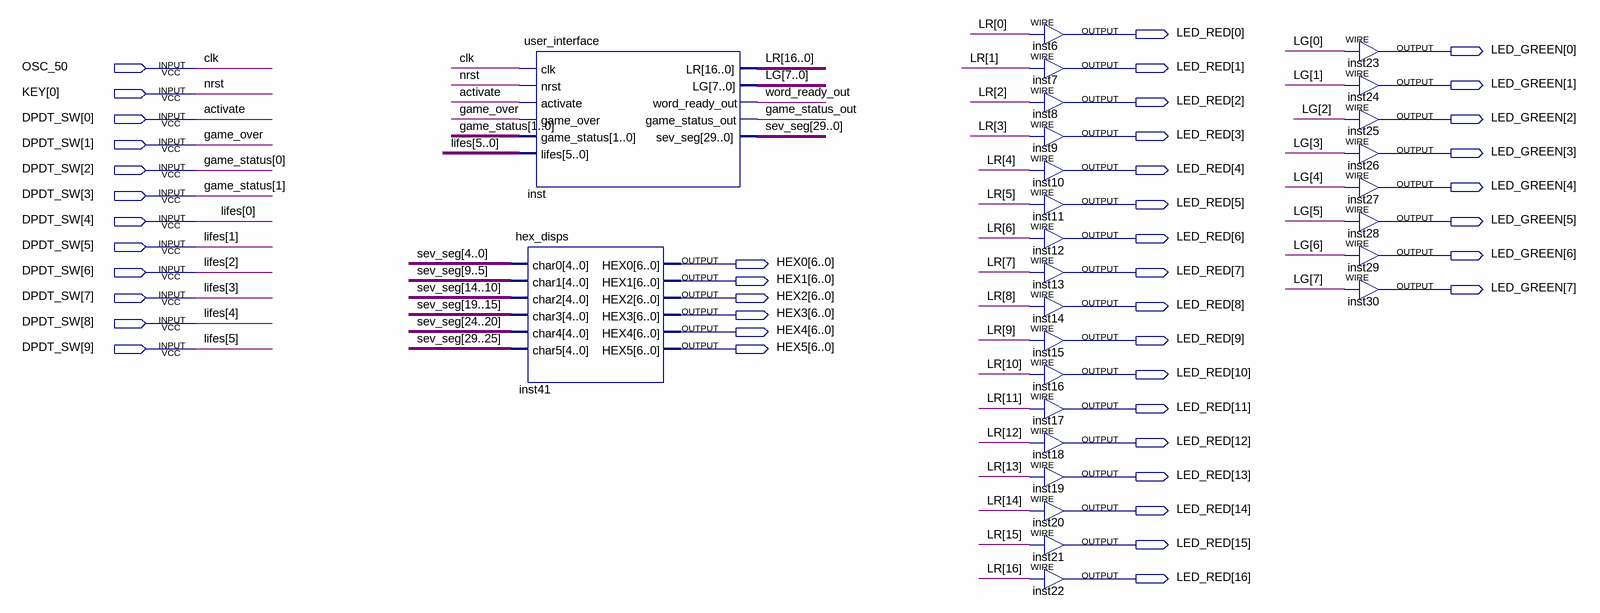
[diagram p0: schematic sheet]
// Quartus schematic user_interface_tes.bdf as structural Verilog: 27 symbols, 43 pins
module user_interface_tes (
  input  OSC_50,
  input  [0:0] KEY,
  input  [9:0] DPDT_SW,
  output [16:0] LED_RED,
  output [7:0] LED_GREEN,
  output [6:0] HEX0,
  output [6:0] HEX1,
  output [6:0] HEX2,
  output [6:0] HEX3,
  output [6:0] HEX4,
  output [6:0] HEX5
);

  wire game_status_out, word_ready_out;
  wire [7:0] LG;
  wire [16:0] LR;
  wire [29:0] sev_seg;

  user_interface inst (
    .clk(OSC_50), .nrst(KEY[0]), .activate(DPDT_SW[0]), .game_over(DPDT_SW[1]), .game_status(DPDT_SW[3:2]),
    .lifes(DPDT_SW[9:4]), .LR(LR), .LG(LG), .word_ready_out(word_ready_out),
    .game_status_out(game_status_out), .sev_seg(sev_seg));
  hex_disps inst41 (
    .char0(sev_seg[4:0]), .char1(sev_seg[9:5]), .char2(sev_seg[14:10]), .char3(sev_seg[19:15]),
    .char4(sev_seg[24:20]), .char5(sev_seg[29:25]), .HEX0(HEX0), .HEX1(HEX1), .HEX2(HEX2), .HEX3(HEX3),
    .HEX4(HEX4), .HEX5(HEX5));
  assign LED_RED[0] = LR[0];  // WIRE inst6
  assign LED_RED[1] = LR[1];  // WIRE inst7
  assign LED_RED[2] = LR[2];  // WIRE inst8
  assign LED_RED[3] = LR[3];  // WIRE inst9
  assign LED_RED[4] = LR[4];  // WIRE inst10
  assign LED_RED[5] = LR[5];  // WIRE inst11
  assign LED_RED[6] = LR[6];  // WIRE inst12
  assign LED_RED[7] = LR[7];  // WIRE inst13
  assign LED_RED[8] = LR[8];  // WIRE inst14
  assign LED_RED[9] = LR[9];  // WIRE inst15
  assign LED_RED[10] = LR[10];  // WIRE inst16
  assign LED_RED[11] = LR[11];  // WIRE inst17
  assign LED_RED[12] = LR[12];  // WIRE inst18
  assign LED_RED[13] = LR[13];  // WIRE inst19
  assign LED_RED[14] = LR[14];  // WIRE inst20
  assign LED_RED[15] = LR[15];  // WIRE inst21
  assign LED_RED[16] = LR[16];  // WIRE inst22
  assign LED_GREEN[0] = LG[0];  // WIRE inst23
  assign LED_GREEN[1] = LG[1];  // WIRE inst24
  assign LED_GREEN[2] = LG[2];  // WIRE inst25
  assign LED_GREEN[3] = LG[3];  // WIRE inst26
  assign LED_GREEN[4] = LG[4];  // WIRE inst27
  assign LED_GREEN[5] = LG[5];  // WIRE inst28
  assign LED_GREEN[6] = LG[6];  // WIRE inst29
  assign LED_GREEN[7] = LG[7];  // WIRE inst30

  // Other names for the same wires on the sheet: activate = DPDT_SW[0]; clk = OSC_50; game_over = DPDT_SW[1];
  //   game_status[1:0] = DPDT_SW[3:2]; lifes[5:0] = DPDT_SW[9:4]; nrst = KEY[0]
endmodule
